# EasyEDA Pro project band.eprj

# Schematic YuzukiESP32 S3 ESP32S3 WiFi 开发板
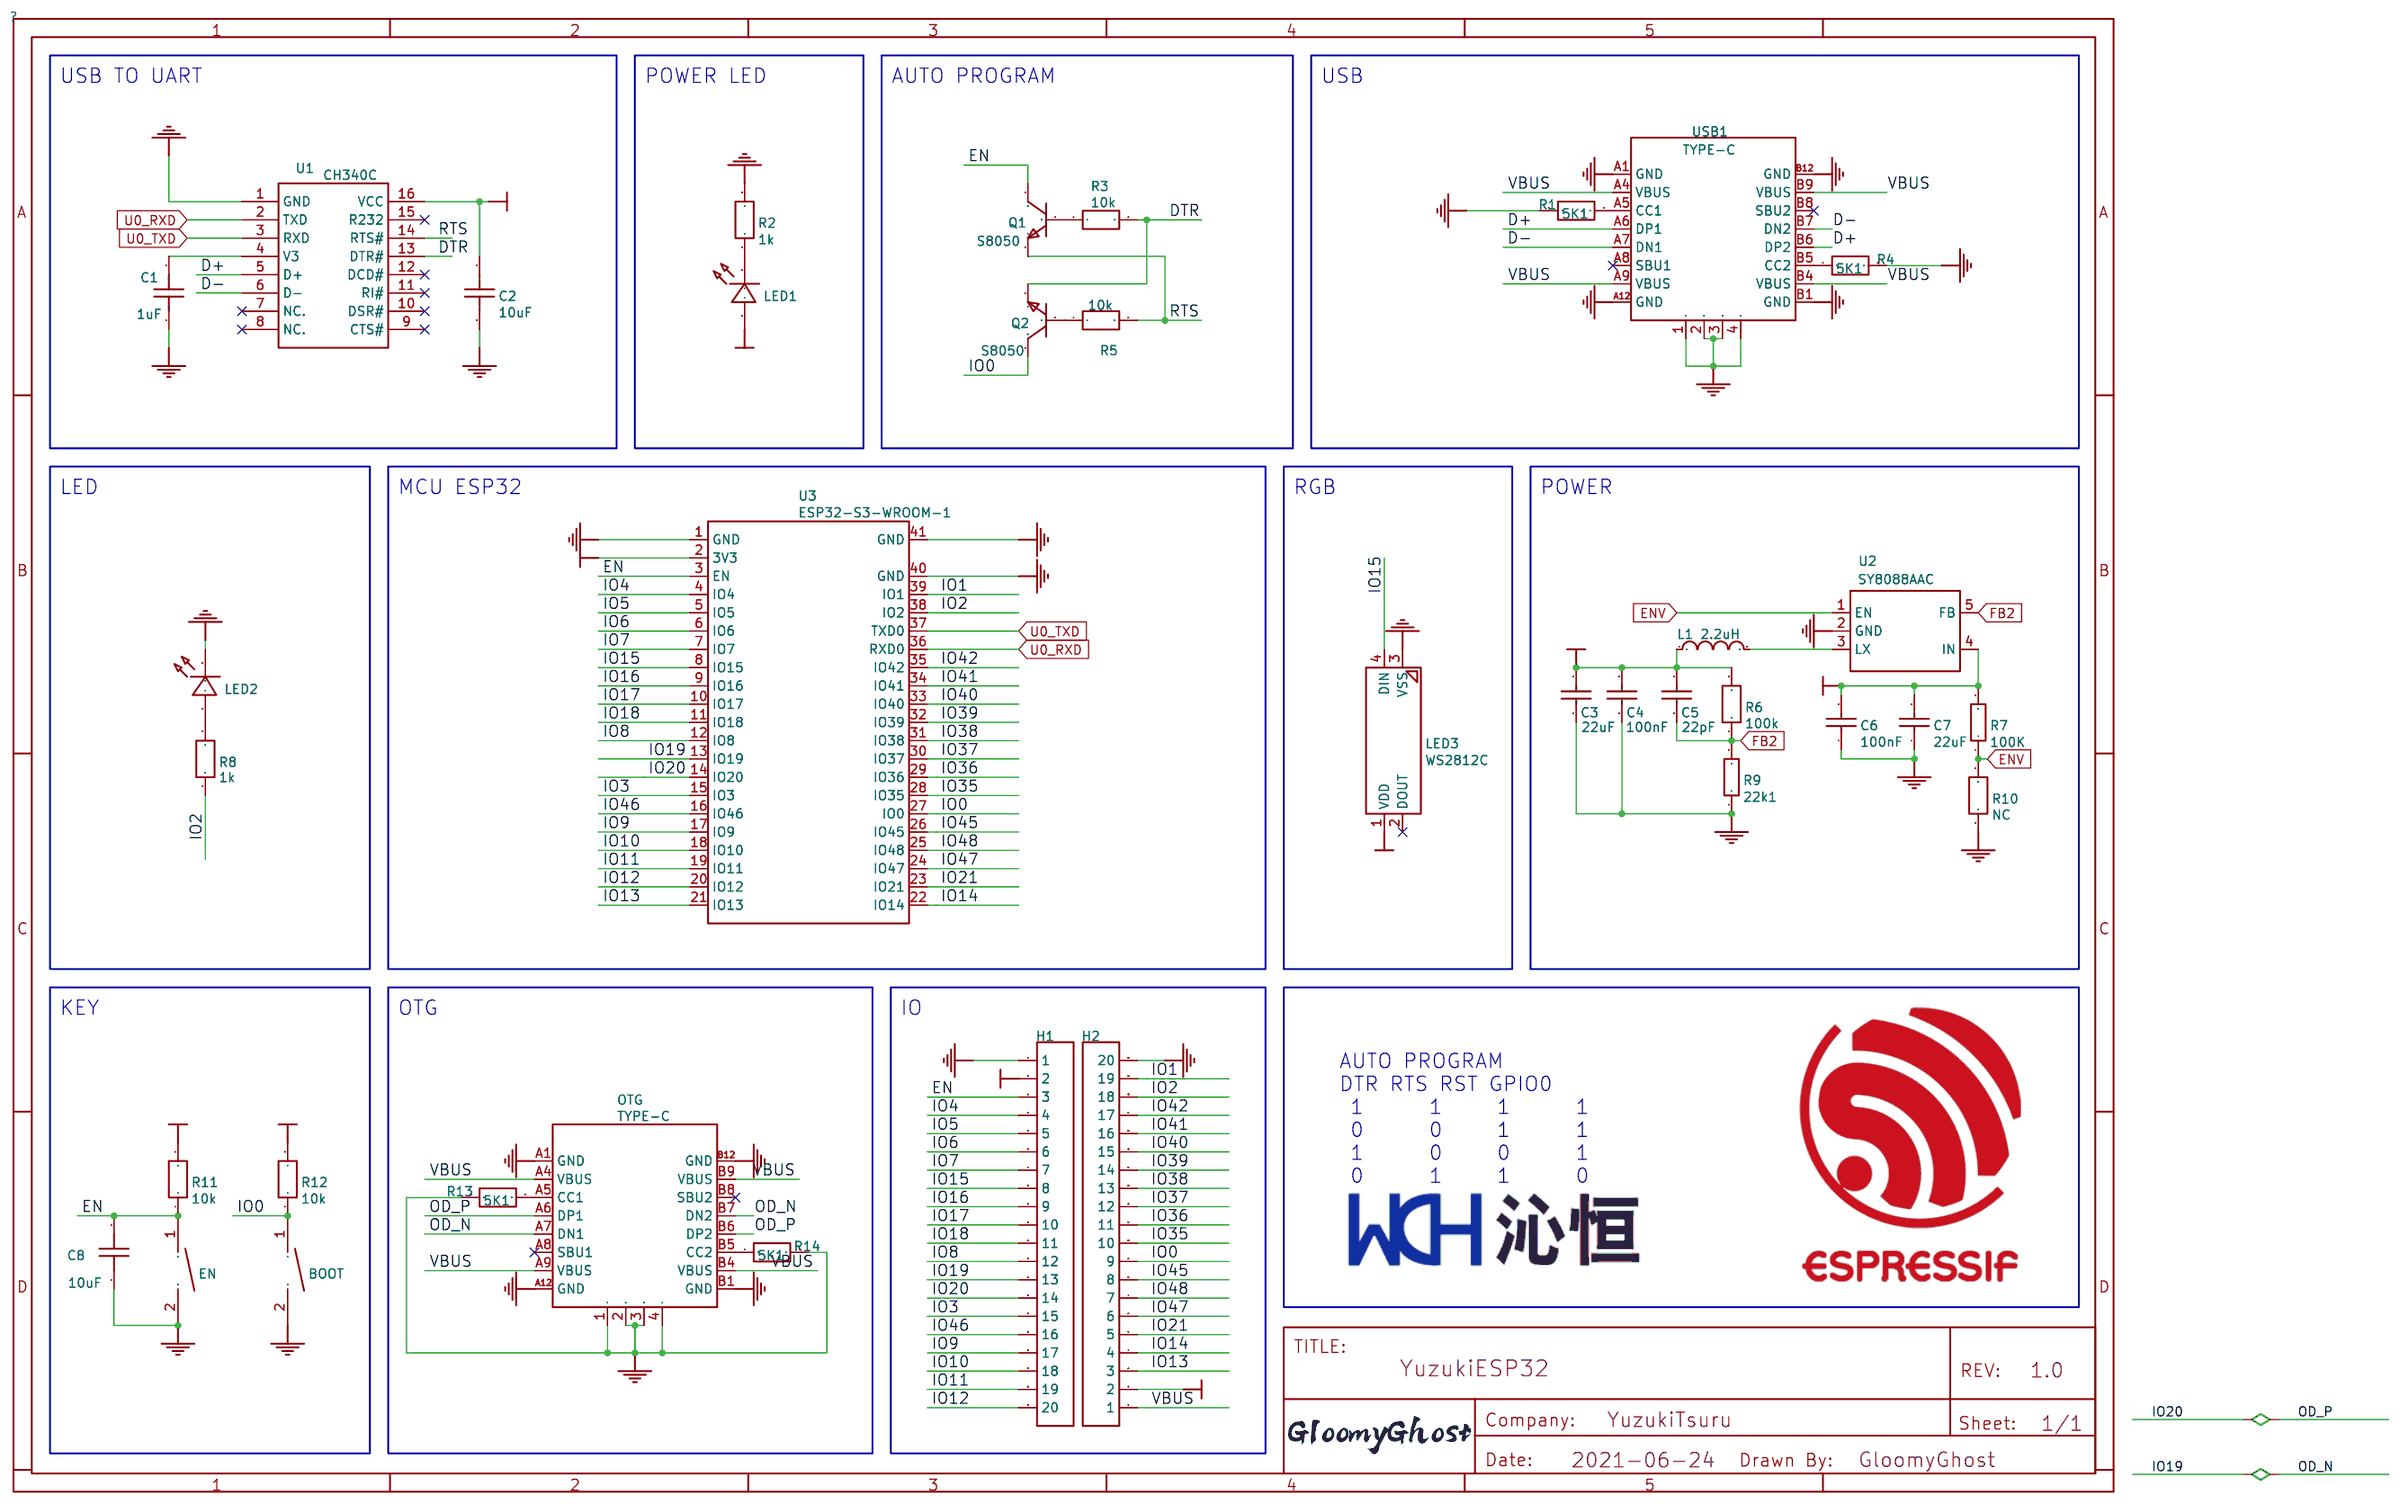
[diagram p0: schematic sheet]

## Parts
BOOT  TSA343G00D-250J2  [SW-SMD_L4.0-W2.9-P4.15-EH]
C1  1uF
C2  10uF
C3  22uF  [C1206]
C4  100nF
C5  22pF
C6  100nF
C7  22uF  [C1206]
C8  10uF
EN  TSA343G00D-250J2  [SW-SMD_L4.0-W2.9-P4.15-EH]
H1  HDR-F-2.54_1x20  [HDR-F-2.54_1X20]
H2  HDR-F-2.54_1x20  [HDR-F-2.54_1X20]
L1  2.2uH  [IND-SMD_L6.6-W6.6]
LED1  LED-0603_R  [LED0603_RED]
LED2  LED-0603_R  [LED0603_RED]
LED3  WS2812C
OTG  TYPE-C  [USB-C-SMD_TYC-302-16]
Q1  S8050  [SOT-23-3_L2.9-W1.3-P1.90-LS2.4-BR]
Q2  S8050  [SOT-23-3_L2.9-W1.3-P1.90-LS2.4-BR]
R1  5K1
R2  1k
R3  10k
R4  5K1
R5  10k
R6  100k
R7  100K
R8  1k
R9  22k1
R10  NC
R11  10k
R12  10k
R13  5K1
R14  5K1
U1  CH340C  [SOP-16_L10.0-W3.9-P1.27-LS6.0-BL]
U2  SY8088AAC  [SOT-23-5_L3.0-W1.7-P0.95-LS2.8-BR]
U3  ESP32-S3-WROOM-1  [WIFIM-SMD_41P-L19.2-W18.0-P1.27]
USB1  TYPE-C  [USB-C-SMD_TYC-302-16]

## Library data of the parts
BOOT EN = TSA343G00D-250J2: Supplier: LCSC; Supplier Part: C354947; Manufacturer: BRIGHT; Paste Type: expand; Assembly Type: smtWeld; Contributor: LCSC; spicePre: S
C1 = 1uF: Supplier Part: C36577; Supplier: LCSC; Manufacturer Part: 0603F105M250NT; Manufacturer: FH; nameAlias: Value(F); Contributor: LCEDA_Lib; spicePre: C; spiceSymbolName: C_0603_US
C2 C8 = 10uF: nameAlias: Value(F); Contributor: LCEDA_Lib; spicePre: C; spiceSymbolName: C_0603_US
C3 C7 = 22uF: Supplier: LCSC; Manufacturer Part: CL31A226KAHNNNE; Manufacturer: SAMSUNG; Supplier Part: C12891; JLCPCB Part Class: Extend; nameAlias: Capacitance; LCSC Assembly: Yes; spicePre: C; spiceSymbolName: CL31A226KAHNNNE
C4 C6 = 100nF: Supplier: LCSC; Manufacturer: FH; Manufacturer Part: 0603B104K500NT; Supplier Part: C30926; nameAlias: Capacitance; spicePre: C; spiceSymbolName: 0603B104K500NT
C5 = 22pF: Supplier: LCSC; Manufacturer: FH; Manufacturer Part: 0603CG220J500NT; Supplier Part: C91701; nameAlias: Capacitance; spicePre: C; spiceSymbolName: 0603B104K500NT
H1 H2 = HDR-F-2.54_1x20: Supplier Part: C50984; Supplier: LCSC; Contributor: LCEDA_Lib; spicePre: H
L1 = 2.2uH: Supplier: LCSC; Supplier Part: C442397; Manufacturer: PSA(Prosperity Dielectrics); Manufacturer Part: MCS0420-2R2MN2; nameAlias: Inductance; Contributor: LCSC; spicePre: L; spiceSymbolName: MCS0420-2R2MN2
LED1 LED2 = LED-0603_R: Manufacturer: EVERLIGHT(台湾亿光); Manufacturer Part: 19-217/R6C-AL1M2VY/3T; Supplier Part: C72044; Supplier: LCSC; Contributor: LCEDA_01; spicePre: L
LED3 = WS2812C: Supplier: LCSC; Manufacturer: Worldsemi; Supplier Part: C114587; JLCPCB Part Class: Extended Part; Contributor: LCSC; spicePre: L
OTG USB1 = TYPE-C: Supplier: LCSC; Supplier Part: C381477; Manufacturer: XUNPU; Manufacturer Part: TYC-302-16; Contributor: LCSC; spicePre: U; spiceSymbolName: TYC-302-16; Package Display: No
Q1 Q2 = S8050: Supplier: LCSC; Supplier Part: C2688231; Manufacturer: WPMtek(维攀微); Contributor: LCSC; spicePre: Q
R1 R4 R13 R14 = 5K1: nameAlias: Value(Ω); Contributor: LCEDA_Lib; spicePre: R; spiceSymbolName: R_0603_EU
R2 R8 = 1k: nameAlias: Value(Ω); Contributor: LCEDA_Lib; spicePre: R; spiceSymbolName: R_0603_EU
R3 R5 R11 R12 = 10k: nameAlias: Value(Ω); Contributor: LCEDA_Lib; spicePre: R; spiceSymbolName: R_0603_EU
R6 = 100k: Supplier Part: C98220; Supplier: LCSC; Manufacturer Part: RC0603FR-0710KL; Manufacturer: YAGEO; nameAlias: Value(Ω); Contributor: LCEDA_Lib; spicePre: R; spiceSymbolName: R_0603_EU
R7 = 100K: Supplier: LCSC; Manufacturer: UniOhm; Manufacturer Part: 0603WAF1003T5E; Supplier Part: C25803; JLCPCB Part Class: Basic; nameAlias: Resistance (Ohms); LCSC Assembly: Yes; spicePre: R; spiceSymbolName: 0603WAF1003T5E
R9 = 22k1: Supplier: LCSC; Manufacturer: UniOhm; Manufacturer Part: 0603WAF2201T5E; Supplier Part: C4190; JLCPCB Part Class: Basic; nameAlias: Resistance (Ohms); LCSC Assembly: Yes; spicePre: R; spiceSymbolName: 0603WAF2201T5E
R10 = NC: nameAlias: Value(Ω); Contributor: LCEDA_Lib; spicePre: R; spiceSymbolName: R_0603_EU
U1 = CH340C: Supplier: LCSC; Manufacturer: WCH; Supplier Part: C84681; Paste Type: recommend; spicePre: U
U2 = SY8088AAC: Supplier: LCSC; Manufacturer: Silergy; Supplier Part: C79313; JLCPCB Part Class: Extend; LCSC Assembly: Yes; spicePre: U
U3 = ESP32-S3-WROOM-1: Supplier: LCSC; Supplier Part: C473005; Manufacturer: Espressif Systems; Manufacturer Part: ESP32-SOLO-1; JLCPCB Part Class: Extended Part; Contributor: LCSC; spicePre: U

## Nets
3V3: C2.2 C3.2 C4.2 C5.1 H1.2 H2.2 L1.1 LED1.1 LED3.1(VDD) R6.2 R11.2 R12.2 U1.16(VCC) U3.2(3V3)
GND: BOOT.2 C1.1 C2.1 C3.1 C4.1 C6.1 C7.1 C8.1 EN.2 H1.1 H2.20 LED2.2 LED3.3(VSS) OTG.1 OTG.2 OTG.3 OTG.4 OTG.A1(GND) OTG.A12(GND) OTG.B1(GND) OTG.B12(GND) R1.1 R2.2 R4.2 R9.1 R10.1 R13.1 R14.2 U1.1(GND) U2.2(GND) U3.1(GND) U3.40(GND) U3.41(GND) USB1.1 USB1.2 USB1.3 USB1.4 USB1.A1(GND) USB1.A12(GND) USB1.B1(GND) USB1.B12(GND)
VBUS: C6.2 C7.2 H2.1 OTG.A4(VBUS) OTG.A9(VBUS) OTG.B4(VBUS) OTG.B9(VBUS) R7.2 U2.4(IN) USB1.A4(VBUS) USB1.A9(VBUS) USB1.B4(VBUS) USB1.B9(VBUS)
D+: U1.5(D+) USB1.A6(DP1) USB1.B6(DP2)
D-: U1.6(D-) USB1.A7(DN1) USB1.B7(DN2)
DTR: Q2.2(E) R3.2 U1.13(DTR#)
EN: C8.2 EN.1 H1.3 Q1.3(C) R11.1 U3.3(EN)
ENV: R7.1 R10.2 U2.1(EN)
FB2: C5.2 R6.1 R9.2 U2.5(FB)
IO0: BOOT.1 H2.9 Q2.3(C) R12.1 U3.27(IO0)
IO1: H2.19 U3.39(IO1)
IO2: H2.18 R8.1 U3.38(IO2)
IO3: H1.15 U3.15(IO3)
IO4: H1.4 U3.4(IO4)
IO5: H1.5 U3.5(IO5)
IO6: H1.6 U3.6(IO6)
IO7: H1.7 U3.7(IO7)
IO8: H1.12 U3.12(IO8)
IO9: H1.17 U3.17(IO9)
IO10: H1.18 U3.18(IO10)
IO11: H1.19 U3.19(IO11)
IO12: H1.20 U3.20(IO12)
IO13: H2.3 U3.21(IO13)
IO14: H2.4 U3.22(IO14)
IO15: H1.8 LED3.4(DIN) U3.8(IO15)
IO16: H1.9 U3.9(IO16)
IO17: H1.10 U3.10(IO17)
IO18: H1.11 U3.11(IO18)
IO19: H1.13 OTG.A7(DN1) OTG.B7(DN2) U3.13(IO19)
IO20: H1.14 OTG.A6(DP1) OTG.B6(DP2) U3.14(IO20)
IO21: H2.5 U3.23(IO21)
IO35: H2.10 U3.28(IO35)
IO36: H2.11 U3.29(IO36)
IO37: H2.12 U3.30(IO37)
IO38: H2.13 U3.31(IO38)
IO39: H2.14 U3.32(IO39)
IO40: H2.15 U3.33(IO40)
IO41: H2.16 U3.34(IO41)
IO42: H2.17 U3.35(IO42)
IO45: H2.8 U3.26(IO45)
IO46: H1.16 U3.16(IO46)
IO47: H2.6 U3.24(IO47)
IO48: H2.7 U3.25(IO48)
RTS: Q1.2(E) R5.2 U1.14(RTS#)
U0_RXD: U1.2(TXD) U3.36(RXD0)
U0_TXD: U1.3(RXD) U3.37(TXD0)
Net-(C1-2): C1.2 U1.4(V3)
Net-(L1-2): L1.2 U2.3(LX)
Net-(LED1-2): LED1.2 R2.1
Net-(LED2-1): LED2.1 R8.2
Net-(OTG-A5): OTG.A5(CC1) R13.2
Net-(OTG-B5): OTG.B5(CC2) R14.1
Net-(Q1-1): Q1.1(B) R3.1
Net-(Q2-1): Q2.1(B) R5.1
Net-(R1-2): R1.2 USB1.A5(CC1)
Net-(R4-1): R4.1 USB1.B5(CC2)

Not connected (* = marked no-connect by the designer): LED3 2(DOUT)*; OTG A8(SBU1)* B8(SBU2)*; U1 7(NC.)* 8(NC.)* 9(CTS#)* 10(DSR#)* 11(RI#)* 12(DCD#)* 15(R232)*; USB1 A8(SBU1)* B8(SBU2)*

## Notes on the sheet
- USB TO UART
- POWER LED
- AUTO PROGRAM
- USB
- LED
- MCU ESP32
- RGB
- POWER
- KEY
- OTG
- IO
- AUTO PROGRAM
  DTR RTS RST GPIO0
   1      1     1      1
   0      0     1      1
   1      0     0      1
   0      1     1      0
